# Altium schematic sheet ScreenerMobo.SchDoc
size A2; SheetNumber: 1; SheetTotal: 5
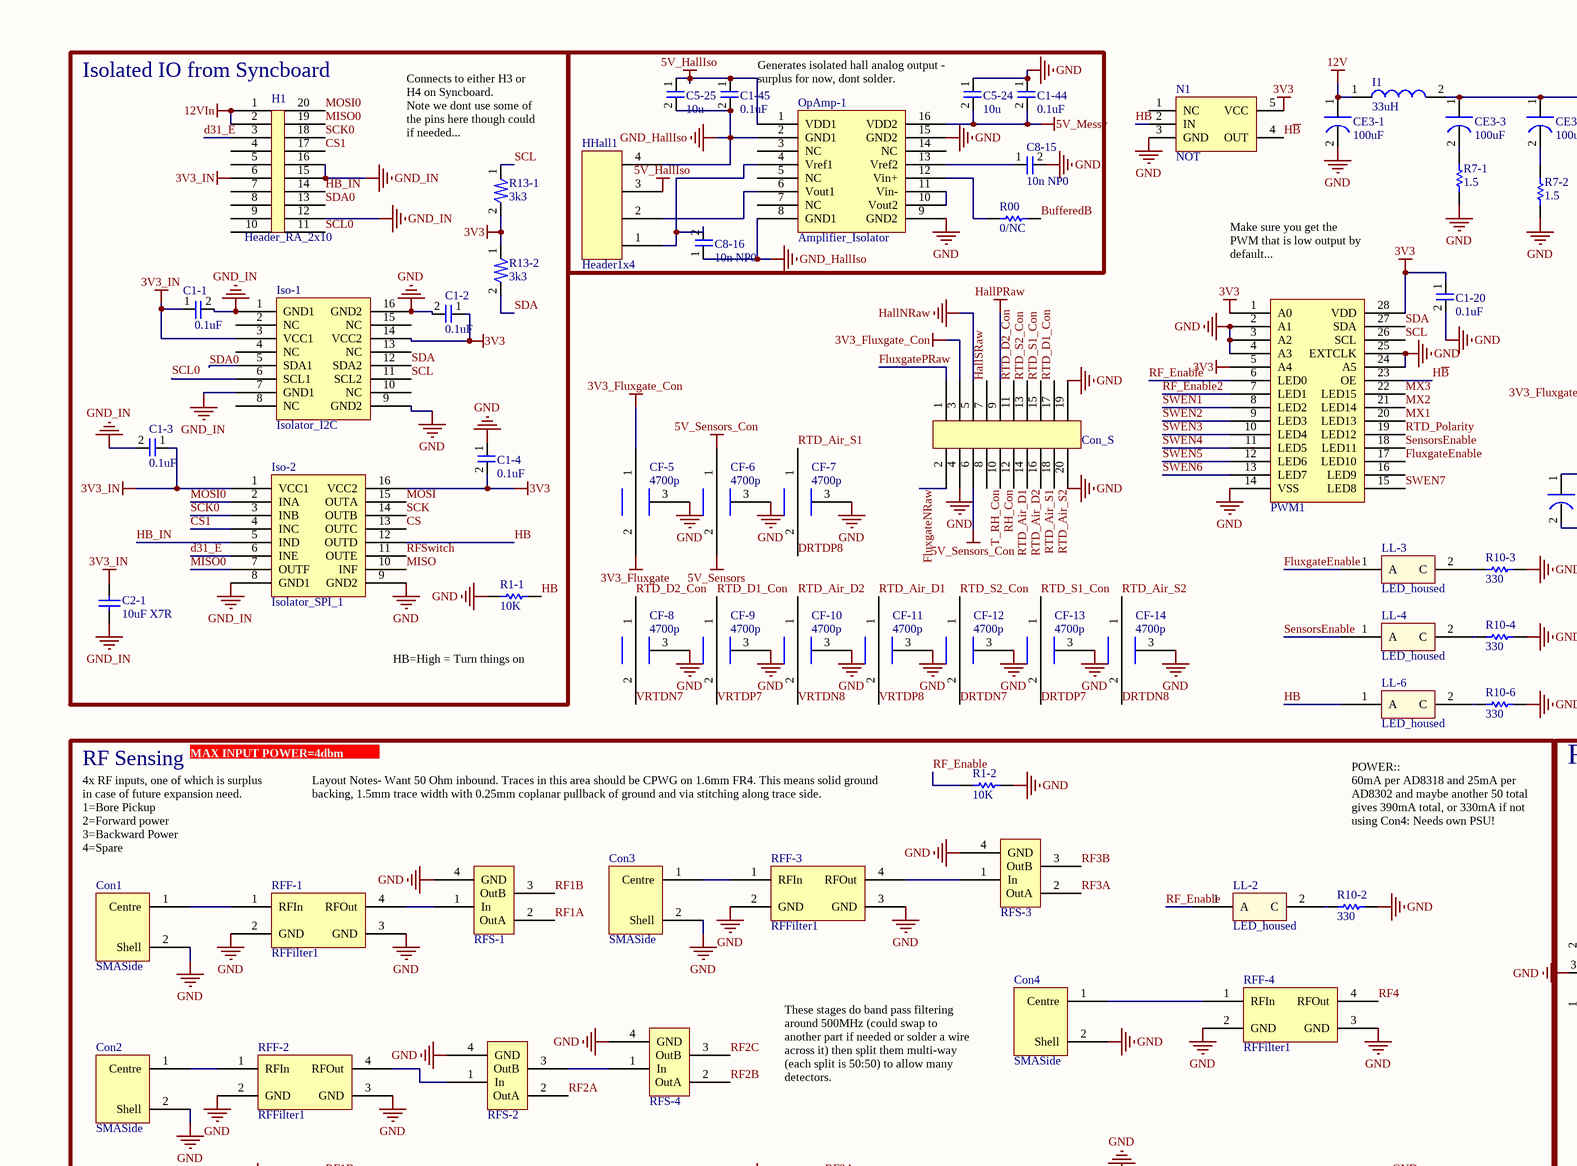
[diagram p0: ScreenerMobo.SchDoc, top left]
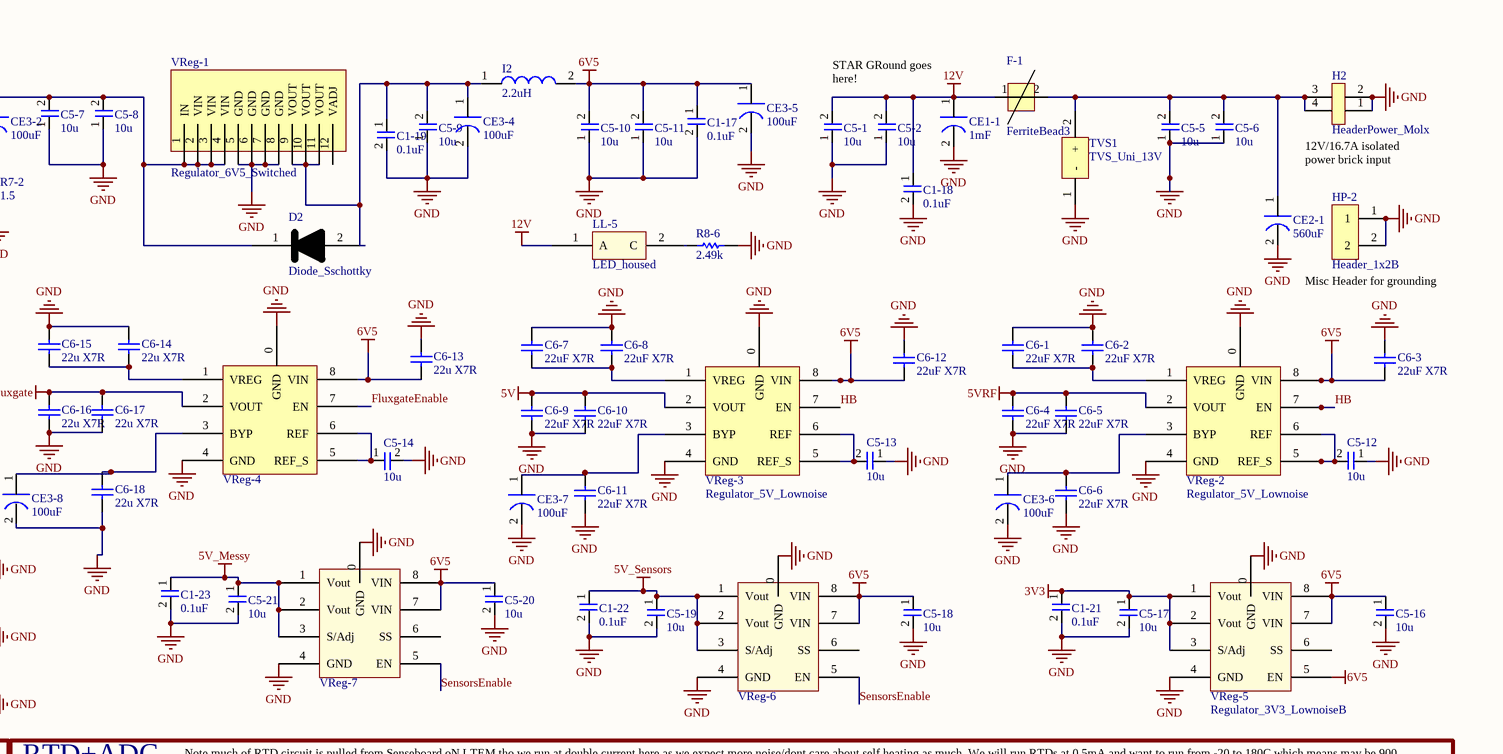
[diagram p1: ScreenerMobo.SchDoc, top right]
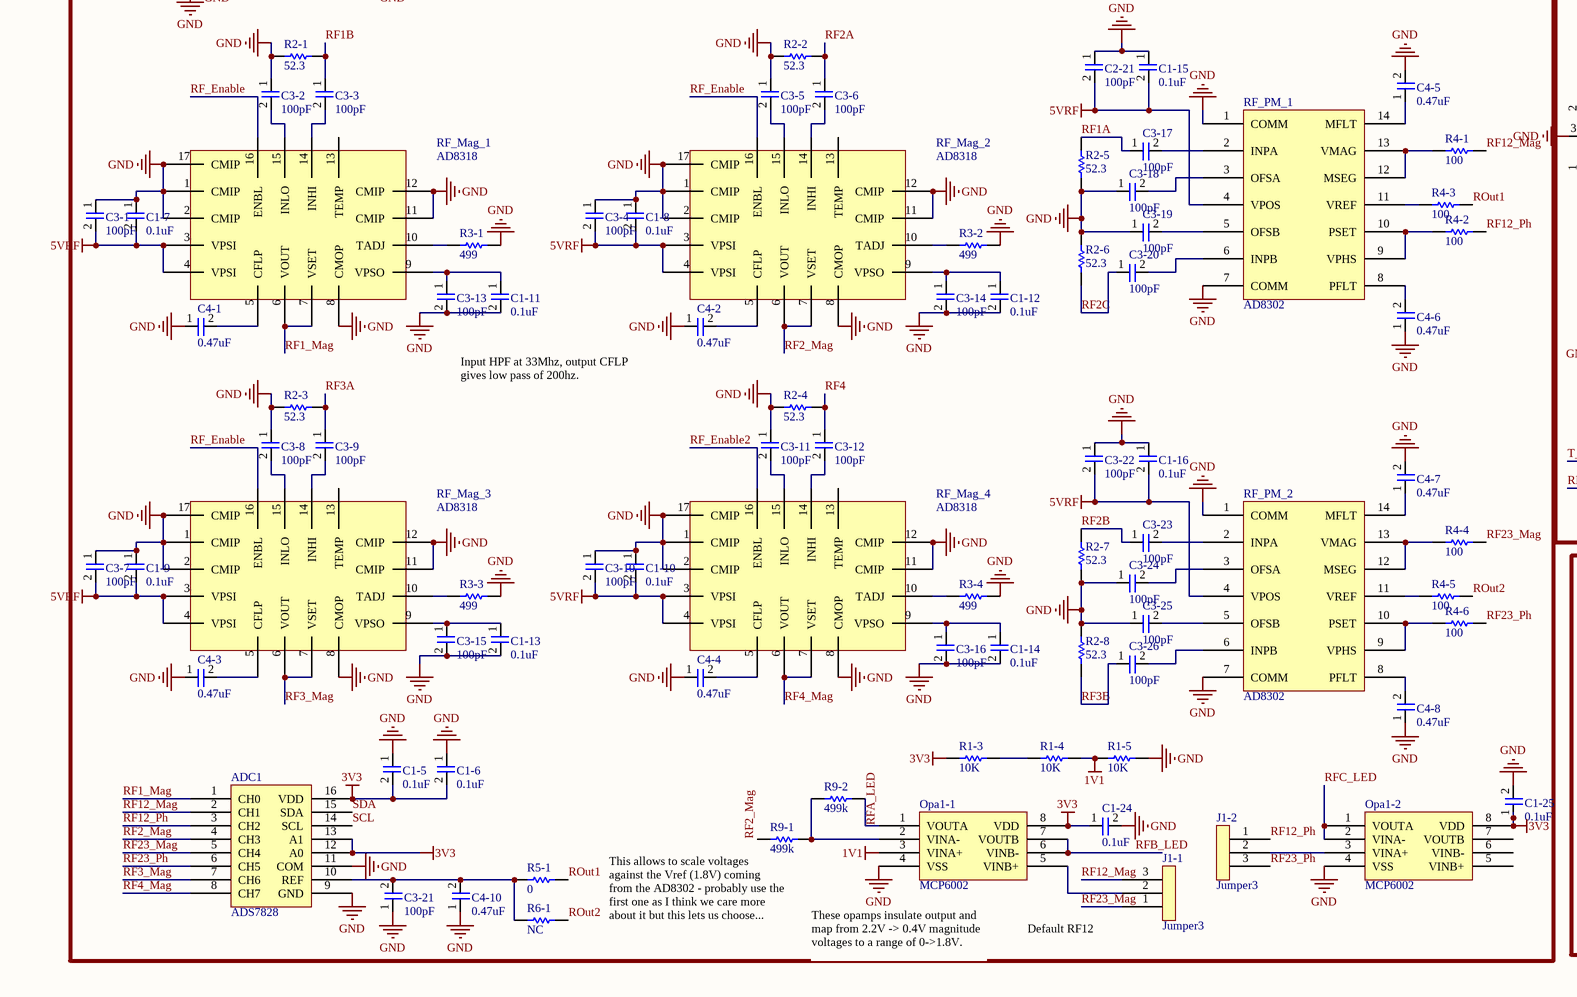
[diagram p2: ScreenerMobo.SchDoc, bottom left]
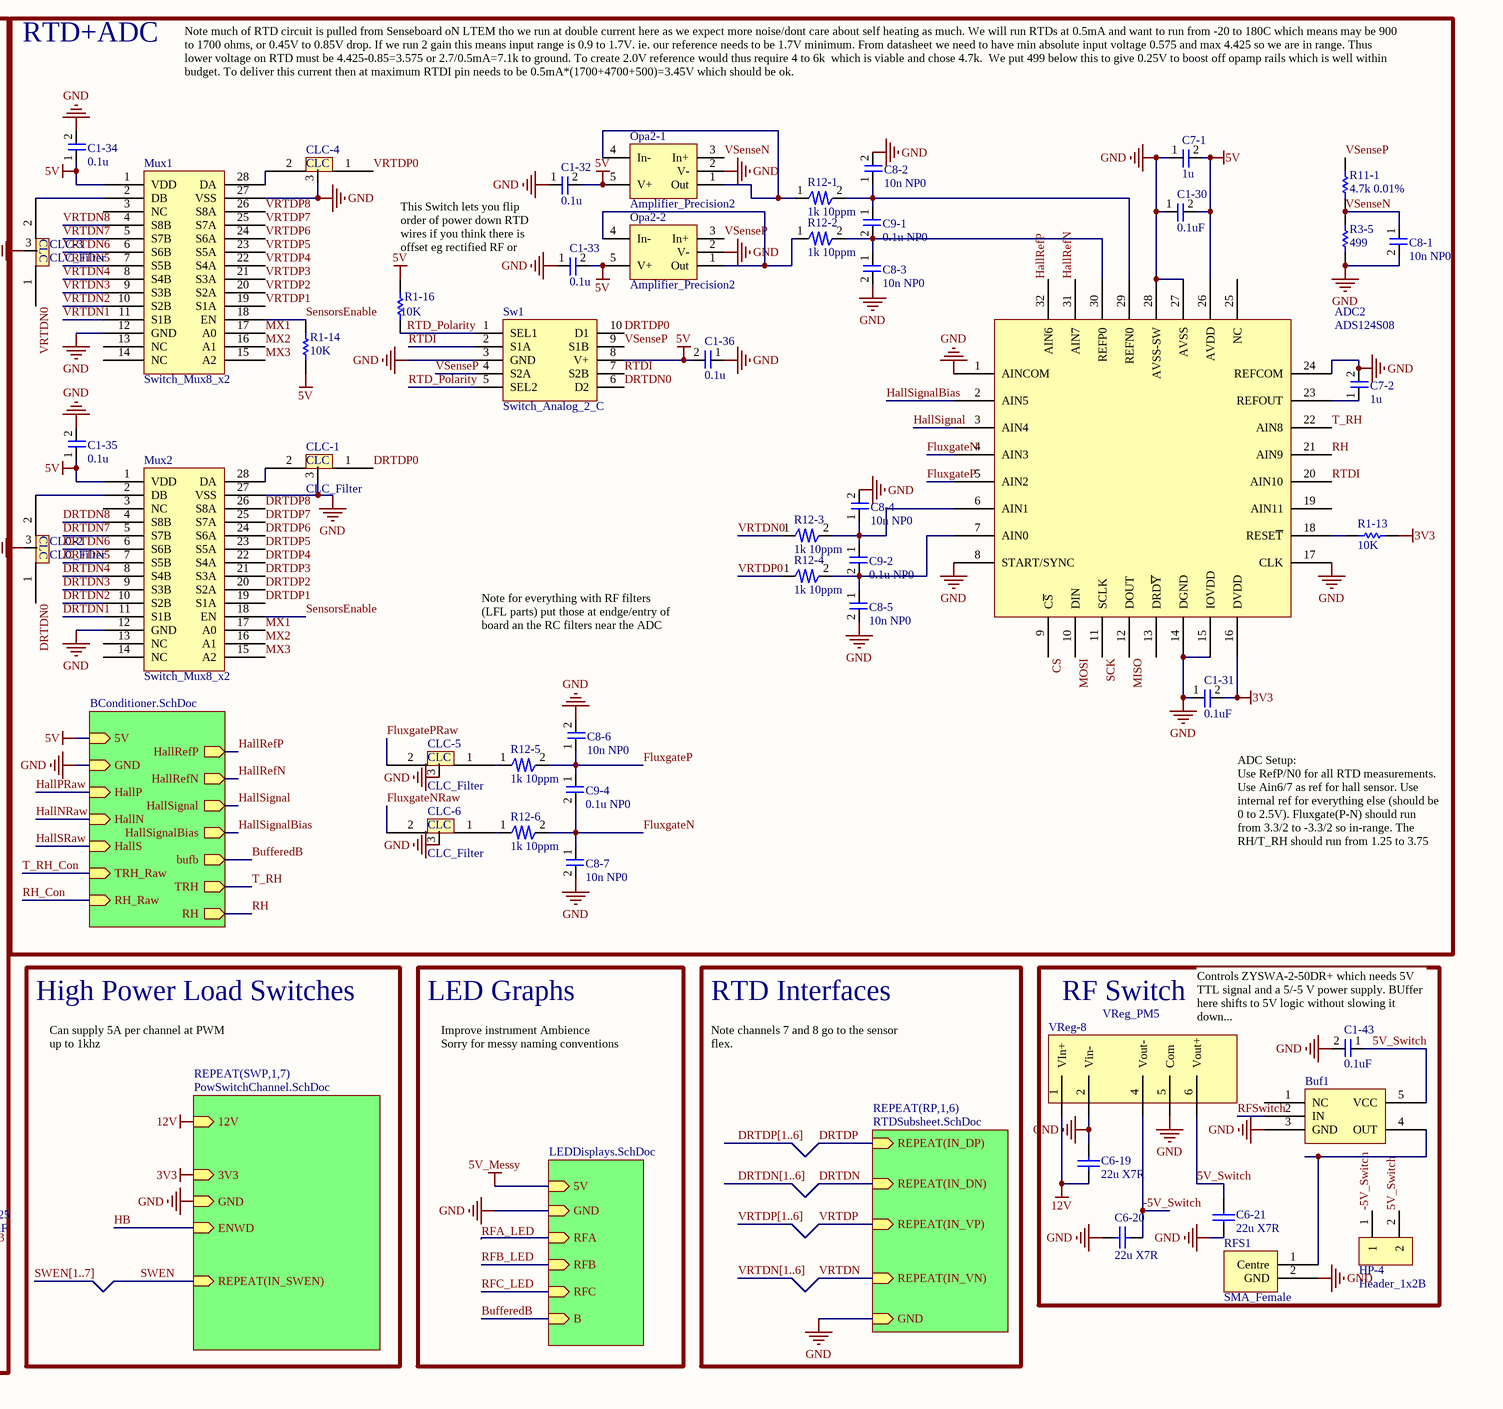
[diagram p3: ScreenerMobo.SchDoc, bottom right]

## Parts
ADC1  ADS7828  [16-TSSOP]
ADC2  ADS124S08  [32-TQFP]
Buf1  Buffer_Logic  [SOT23-5]  (value not drawn)
C1-1  0.1uF  [0805]
C1-2  0.1uF  [0805]
C1-3  0.1uF  [0805]
C1-4  0.1uF  [0805]
C1-5  0.1uF  [0805]
C1-6  0.1uF  [0805]
C1-7  0.1uF  [0805]
C1-8  0.1uF  [0805]
C1-9  0.1uF  [0805]
C1-10  0.1uF  [0805]
C1-11  0.1uF  [0805]
C1-12  0.1uF  [0805]
C1-13  0.1uF  [0805]
C1-14  0.1uF  [0805]
C1-15  0.1uF  [0805]
C1-16  0.1uF  [0805]
C1-17  0.1uF  [0805]
C1-18  0.1uF  [0805]
C1-19  0.1uF  [0805]
C1-20  0.1uF  [0805]
C1-21  0.1uF  [0805]
C1-22  0.1uF  [0805]
C1-23  0.1uF  [0805]
C1-24  0.1uF  [0805]
C1-25  0.1uF  [0805]
C1-30  0.1uF  [0805]
C1-31  0.1uF  [0805]
C1-32  0.1u  [0805]
C1-33  0.1u  [0805]
C1-34  0.1u  [0805]
C1-35  0.1u  [0805]
C1-36  0.1u  [0805]
C1-43  0.1uF  [0805]
C1-44  0.1uF  [0805]
C1-45  0.1uF  [0805]
C2-1  10uF X7R  [1206]
C2-21  100pF  [0402]
C3-1  100pF  [0402]
C3-2  100pF  [0402]
C3-3  100pF  [0402]
C3-4  100pF  [0402]
C3-5  100pF  [0402]
C3-6  100pF  [0402]
C3-7  100pF  [0402]
C3-8  100pF  [0402]
C3-9  100pF  [0402]
C3-10  100pF  [0402]
C3-11  100pF  [0402]
C3-12  100pF  [0402]
C3-13  100pF  [0402]
C3-14  100pF  [0402]
C3-15  100pF  [0402]
C3-16  100pF  [0402]
C3-17  100pF  [0402]
C3-18  100pF  [0402]
C3-19  100pF  [0402]
C3-20  100pF  [0402]
C3-21  100pF  [0402]
C3-22  100pF  [0402]
C3-23  100pF  [0402]
C3-24  100pF  [0402]
C3-25  100pF  [0402]
C3-26  100pF  [0402]
C4-1  0.47uF  [0805]
C4-2  0.47uF  [0805]
C4-3  0.47uF  [0805]
C4-4  0.47uF  [0805]
C4-5  0.47uF  [0805]
C4-6  0.47uF  [0805]
C4-7  0.47uF  [0805]
C4-8  0.47uF  [0805]
C4-10  0.47uF  [0805]
C5-1  10u  [1206]
C5-2  10u  [1206]
C5-5  10u  [1206]
C5-6  10u  [1206]
C5-7  10u  [1206]
C5-8  10u  [1206]
C5-9  10u  [1206]
C5-10  10u  [1206]
C5-11  10u  [1206]
C5-12  10u  [1206]
C5-13  10u  [1206]
C5-14  10u  [1206]
C5-16  10u  [1206]
C5-17  10u  [1206]
C5-18  10u  [1206]
C5-19  10u  [1206]
C5-20  10u  [1206]
C5-21  10u  [1206]
C5-24  10u  [1206]
C5-25  10u  [1206]
C6-1  22uF X7R  [1206]
C6-2  22uF X7R  [1206]
C6-3  22uF X7R  [1206]
C6-4  22uF X7R  [1206]
C6-5  22uF X7R  [1206]
C6-6  22uF X7R  [1206]
C6-7  22uF X7R  [1206]
C6-8  22uF X7R  [1206]
C6-9  22uF X7R  [1206]
C6-10  22uF X7R  [1206]
C6-11  22uF X7R  [1206]
C6-12  22uF X7R  [1206]
C6-13  22u X7R  [1206]
C6-14  22u X7R  [1206]
C6-15  22u X7R  [1206]
C6-16  22u X7R  [1206]
C6-17  22u X7R  [1206]
C6-18  22u X7R  [1206]
C6-19  22u X7R  [1206]
C6-20  22u X7R  [1206]
C6-21  22u X7R  [1206]
C7-1  1u  [0805]
C7-2  1u  [0805]
C8-1  10n NP0  [0805]
C8-2  10n NP0  [0805]
C8-3  10n NP0  [0805]
C8-4  10n NP0  [0805]
C8-5  10n NP0  [0805]
C8-6  10n NP0  [0805]
C8-7  10n NP0  [0805]
C8-15  10n NP0  [0805]
C8-16  10n NP0  [0805]
C9-1  0.1u NP0  [1206]
C9-2  0.1u NP0  [1206]
C9-4  0.1u NP0  [1206]
CE1-1  1mF  [CapElec]
CE2-1  560uF  [CapElec]
CE3-1  100uF  [ElectrolyticCapacitor3]
CE3-2  100uF  [ElectrolyticCapacitor3]
CE3-3  100uF  [ElectrolyticCapacitor3]
CE3-4  100uF  [ElectrolyticCapacitor3]
CE3-5  100uF  [ElectrolyticCapacitor3]
CE3-6  100uF  [ElectrolyticCapacitor3]
CE3-7  100uF  [ElectrolyticCapacitor3]
CE3-8  100uF  [ElectrolyticCapacitor3]
CF-5  4700p  [0402-Passthrough]
CF-6  4700p  [0402-Passthrough]
CF-7  4700p  [0402-Passthrough]
CF-8  4700p  [0402-Passthrough]
CF-9  4700p  [0402-Passthrough]
CF-10  4700p  [0402-Passthrough]
CF-11  4700p  [0402-Passthrough]
CF-12  4700p  [0402-Passthrough]
CF-13  4700p  [0402-Passthrough]
CF-14  4700p  [0402-Passthrough]
CLC-1  CLC_Filter  [CRCFilter]
CLC-2  CLC_Filter  [CRCFilter]
CLC-3  CLC_Filter  [CRCFilter]
CLC-4  CLC_Filter  [CRCFilter]  (value not drawn)
CLC-5  CLC_Filter  [CRCFilter]
CLC-6  CLC_Filter  [CRCFilter]
Con1  SMASide  [SMA_Side]
Con2  SMASide  [SMA_Side]
Con3  SMASide  [SMA_Side]
Con4  SMASide  [SMA_Side]
Con_S  Connector_LSHM_110  [Connector_LSHM_110]  (value not drawn)
D2  Diode_Sschottky  [SOD-123F]
F-1  FerriteBead3  [FerriteBead1]
H1  Header_RA_2x10  [HeaderRA 2x10]
H2  HeaderPower_Molx  [Header Molex Mini-Fit Jr 5569 - duplicate]
HHall1  Header1x4  [Header4x1]
HP-2  Header_1x2B  [Header_1x2B]
HP-4  Header_1x2B  [Header_1x2B]
I1  33uH  [INDUCTOR6]
I2  2.2uH  [INDUCTOR7]
Iso-1  Isolator_I2C  [16-SOIC Wide]
Iso-2  Isolator_SPI_1  [16-SOIC Wide]
J1-1  Jumper3  [Jumper]
J1-2  Jumper3  [Jumper]
LL-2  LED_housed  [LED_Housed]
LL-3  LED_housed  [LED_Housed]
LL-4  LED_housed  [LED_Housed]
LL-5  LED_housed  [LED_Housed]
LL-6  LED_housed  [LED_Housed]
Mux1  Switch_Mux8_x2  [28-TSSOP]
Mux2  Switch_Mux8_x2  [28-TSSOP]
N1  NOT  [SOT23-5]
Opa1-1  MCP6002  [8-MSOP]
Opa1-2  MCP6002  [8-MSOP]
Opa2-1  Amplifier_Precision2  [SOT23-5]
Opa2-2  Amplifier_Precision2  [SOT23-5]
OpAmp-1  Amplifier_Isolator  [16-QSOP]
PWM1  PWM28  [28-TSSOP]  (value not drawn)
R00  0/NC  [0603]
R1-1  10K  [0603]
R1-2  10K  [0603]
R1-3  10K  [0603]
R1-4  10K  [0603]
R1-5  10K  [0603]
R1-13  10K  [0603]
R1-14  10K  [0603]
R1-16  10K  [0603]
R2-1  52.3  [0603]
R2-2  52.3  [0603]
R2-3  52.3  [0603]
R2-4  52.3  [0603]
R2-5  52.3  [0603]
R2-6  52.3  [0603]
R2-7  52.3  [0603]
R2-8  52.3  [0603]
R3-1  499  [0603]
R3-2  499  [0603]
R3-3  499  [0603]
R3-4  499  [0603]
R3-5  499  [0603]
R4-1  100  [0603]
R4-2  100  [0603]
R4-3  100  [0603]
R4-4  100  [0603]
R4-5  100  [0603]
R4-6  100  [0603]
R5-1  0  [0603]
R6-1  NC  [0603]
R7-1  1.5  [1206]
R7-2  1.5  [1206]
R8-6  2.49k  [0603]
R9-1  499k  [0603]
R9-2  499k  [0603]
R10-2  330  [0603]
R10-3  330  [0603]
R10-4  330  [0603]
R10-6  330  [0603]
R11-1  4.7k 0.01%  [0805]
R12-1  1k 10ppm  [0805]
R12-2  1k 10ppm  [0805]
R12-3  1k 10ppm  [0805]
R12-4  1k 10ppm  [0805]
R12-5  1k 10ppm  [0805]
R12-6  1k 10ppm  [0805]
R13-1  3k3  [0805]
R13-2  3k3  [0805]
RF_Mag_1  AD8318  [16-LFCSP]
RF_Mag_2  AD8318  [16-LFCSP]
RF_Mag_3  AD8318  [16-LFCSP]
RF_Mag_4  AD8318  [16-LFCSP]
RF_PM_1  AD8302  [14-TSSOP]
RF_PM_2  AD8302  [14-TSSOP]
RFF-1  RFFilter1  [RFFilter1]
RFF-2  RFFilter1  [RFFilter1]
RFF-3  RFFilter1  [RFFilter1]
RFF-4  RFFilter1  [RFFilter1]
RFS1  SMA_Female  [SMA_Ferrite]
RFS-1  RFSplitter1  [PS3216]  (value not drawn)
RFS-2  RFSplitter1  [PS3216]  (value not drawn)
RFS-3  RFSplitter1  [PS3216]  (value not drawn)
RFS-4  RFSplitter1  [PS3216]  (value not drawn)
Sw1  Switch_Analog_2_C  [10-VSSOP]
TVS1  TVS_Uni_13V  [DO-214AB-Uni]
VReg-1  Regulator_6V5_Switched  [12-SIP]
VReg-2  Regulator_5V_Lownoise  [8-SOIC]
VReg-3  Regulator_5V_Lownoise  [8-SOIC]
VReg-4  Regulator_3V3_Lownoise  [8-SOIC]  (value not drawn)
VReg-5  Regulator_3V3_LownoiseB  [8-SOIC]
VReg-6  Regulator_3V3_LownoiseB  [8-SOIC]  (value not drawn)
VReg-7  Regulator_3V3_LownoiseB  [8-SOIC]  (value not drawn)
VReg-8  VReg_PM5  [7-SIP]

## Blocks framed on the sheet
Isolated IO from Syncboard: C1-1-C1-4 C2-1 H1 Iso-1 Iso-2 R1-1 R13-1 R13-2
RF Sensing: ADC1 C1-5-C1-16 C1-24 C1-25 C2-21 C3-1-C3-26 C4-1-C4-8 C4-10 Con1-Con4 J1-1 J1-2 LL-2 Opa1-1 Opa1-2 R1-2-R1-5 R2-1-R2-8 R3-1-R3-4 R4-1-R4-6 R5-1 R6-1 R9-1 R9-2 R10-2 RF_Mag_1-RF_Mag_4 RF_PM_1 RF_PM_2 RFF-1-RFF-4 RFS-1-RFS-4
RTD+ADC: ADC2 C1-30-C1-36 C7-1 C7-2 C8-1-C8-7 C9-1 C9-2 C9-4 CLC-1-CLC-6 Mux1 Mux2 Opa2-1 Opa2-2 R1-13 R1-14 R1-16 R3-5 R11-1 R12-1-R12-6 Sw1
RF Switch: Buf1 C1-43 C6-19-C6-21 HP-4 RFS1 VReg-8

## Sub-sheets
Designator = BConditioner.SchDoc: 5V (in), GND (in), HallP (in), HallN (in), HallS (in), HallRefP (out), HallRefN (out), HallSignal (out), HallSignalBias (out), TRH_Raw (in), RH_Raw (in), TRH (out), RH (out), bufb (out)
REPEAT(RP,1,6) = RTDSubsheet.SchDoc: GND (in), REPEAT(IN_VN) (in), REPEAT(IN_VP) (in), REPEAT(IN_DN) (in), REPEAT(IN_DP) (in)
REPEAT(SWP,1,7) = PowSwitchChannel.SchDoc: 12V (in), 3V3 (in), GND (in), ENWD (in), REPEAT(IN_SWEN) (in)
? = LEDDisplays.SchDoc: 5V (in), RFA (in), GND (in), RFB (in), RFC (in), B (in)

## Nets
1V1: Opa1-1.3(VINA+) R1-4.1 R1-5.2
3V3: ADC1.12(A0) ADC1.13(A1) ADC1.16(VDD) ADC2.16(DVDD) C1-2.1 C1-4.2 C1-5.2 C1-6.2 C1-20.1 C1-21.1 C1-24.1 C1-25.1 C1-31.2 C5-17.1 Iso-1.14(VCC2) Iso-2.16(VCC2) N1.5(VCC) Opa1-1.8(VDD) Opa1-2.8(VDD) PWM1.1(A0) PWM1.5(A4) PWM1.28(VDD) R1-3.2 R1-13.2 R13-1.2 R13-2.1 VReg-5.1(Vout) VReg-5.2(Vout) VReg-5.3(S/Adj) ; sheet REPEAT(SWP,1,7)/3V3
3V3_Fluxgate: C6-16.2 C6-17.2 CF-5.2 VReg-4.2(VOUT)
3V3_Fluxgate_Con: CF-5.1 Con_S.3
3V3_IN: C1-1.1 C1-3.1 C2-1.1 H1.6 Iso-1.3(VCC1) Iso-2.1(VCC1)
5V: ADC2.26(AVDD) C1-30.2 C1-32.2 C1-33.2 C1-34.1 C1-35.1 C1-36.2 C6-9.2 C6-10.2 C7-1.2 Mux1.1(VDD) Mux2.1(VDD) Opa2-1.5(V+) Opa2-2.5(V+) R1-14.2 R1-16.1 Sw1.8(V+) VReg-3.2(VOUT) ; sheet Designator/5V
5V_HallIso: C1-45.1 C5-25.1 HHall1.3 OpAmp-1.1(VDD1)
5V_Messy: C1-23.1 C1-44.2 C5-21.1 C5-24.2(C1-1) OpAmp-1.16(VDD2) VReg-7.1(Vout) VReg-7.2(Vout) VReg-7.3(S/Adj) ; sheet /5V
5V_Sensors: C1-22.1 C5-19.1 CF-6.2 VReg-6.1(Vout) VReg-6.2(Vout) VReg-6.3(S/Adj)
5V_Sensors_Con: CF-6.1 Con_S.6
5VRF: C1-7.2 C1-8.2 C1-9.2 C1-10.2 C1-15.2 C1-16.2 C2-21.2 C3-1.2 C3-4.2 C3-7.2 C3-10.2 C3-22.2 C6-4.2 C6-5.2 RF_Mag_1.3(VPSI) RF_Mag_1.4(VPSI) RF_Mag_2.3(VPSI) RF_Mag_2.4(VPSI) RF_Mag_3.3(VPSI) RF_Mag_3.4(VPSI) RF_Mag_4.3(VPSI) RF_Mag_4.4(VPSI) RF_PM_1.4(VPOS) RF_PM_2.4(VPOS) VReg-2.2(VOUT)
6V5: C1-17.1 C5-10.2(C1-1) C5-11.2(C1-1) C5-16.1 C5-18.1 C5-20.1 C6-3.1 C6-12.1 C6-13.1 CE3-5.1 I2.2 VReg-2.8(VIN) VReg-3.8(VIN) VReg-4.8(VIN) VReg-5.5(EN) VReg-5.7(VIN) VReg-5.8(VIN) VReg-6.7(VIN) VReg-6.8(VIN) VReg-7.7(VIN) VReg-7.8(VIN)
12V: C1-18.1 C5-1.2(C1-1) C5-2.2(C1-1) C6-19.2 CE1-1.1 CE3-1.1 F-1.1 I1.1 LL-5.1(A) VReg-8.1(VIn+) ; sheet REPEAT(SWP,1,7)/12V
12VIn: H1.1 H1.2
GND: ADC1.9(GND) ADC1.11(COM) ADC2.1(AINCOM) ADC2.8(START/SYNC) ADC2.14(DGND) ADC2.15(IOVDD) ADC2.17(CLK) ADC2.24(REFCOM) ADC2.27(AVSS) ADC2.28(AVSS-SW) Buf1.3(GND) C1-2.2 C1-4.1 C1-5.1 C1-6.1 C1-7.1 C1-8.1 C1-9.1 C1-10.1 C1-11.2 C1-12.2 C1-13.2 C1-14.2 C1-15.1 C1-16.1 C1-17.2 C1-18.2 C1-19.2 C1-20.2 C1-21.2 C1-22.2 C1-23.2 C1-24.2 C1-25.2 C1-30.1 C1-31.1 C1-32.1 C1-33.1 C1-34.2 C1-35.2 C1-36.1 C1-43.2 C1-44.1 C2-21.1 C3-1.1 C3-2.1 C3-4.1 C3-5.1 C3-7.1 C3-8.1 C3-10.1 C3-11.1 C3-13.2 C3-14.2 C3-15.2 C3-16.2 C3-18.1 C3-19.1 C3-21.1 C3-22.1 C3-24.1 C3-25.1 C4-1.1 C4-2.1 C4-3.1 C4-4.1 C4-5.2 C4-6.1 C4-7.2 C4-8.1 C4-10.1 C5-1.1 C5-2.1 C5-5.1 C5-6.1 C5-7.1 C5-8.1 C5-9.1 C5-10.1 C5-11.1 C5-12.1 C5-13.1 C5-14.2 C5-16.2 C5-17.2 C5-18.2 C5-19.2 C5-20.2 C5-21.2 C5-24.1 C6-1.2 C6-2.2 C6-3.2 C6-4.1 C6-5.1 C6-6.1 C6-7.2 C6-8.2 C6-9.1 C6-10.1 C6-11.1 C6-12.2 C6-13.2 C6-14.2 C6-15.2 C6-16.1 C6-17.1 C6-18.1 C6-19.1 C6-20.1 C6-21.1 C7-1.1 C7-2.2 C8-1.2 C8-2.2 C8-3.2 C8-4.2 C8-5.2 C8-6.2 C8-7.2 C8-15.2 CE1-1.2 CE2-1.2 CE3-1.2 CE3-4.2 CE3-5.2 CE3-6.2 CE3-7.2 CE3-8.2 CF-5.3 CF-6.3 CF-7.3 CF-8.3 CF-9.3 CF-10.3 CF-11.3 CF-12.3 CF-13.3 CF-14.3 CLC-1.3 CLC-2.3 CLC-3.3 CLC-4.3 CLC-5.3 CLC-6.3 Con1.2(Shell) Con2.2(Shell) Con3.2(Shell) Con4.2(Shell) Con_S.4 Con_S.19 Con_S.20 H2.1 H2.2 HP-2.1 HP-2.2 Iso-1.9(GND2) Iso-1.16(GND2) Iso-2.9(GND2) Mux1.12(GND) Mux1.27(VSS) Mux2.12(GND) Mux2.27(VSS) N1.3(GND) Opa1-1.4(VSS) Opa1-2.4(VSS) Opa2-1.2(V-) Opa2-2.2(V-) OpAmp-1.9(GND2) OpAmp-1.15(GND2) PWM1.2(A1) PWM1.3(A2) PWM1.4(A3) PWM1.14(VSS) PWM1.24(A5) PWM1.25(EXTCLK) R1-1.1 R1-2.1 R1-5.1 R2-1.2 R2-2.2 R2-3.2 R2-4.2 R2-5.2 R2-6.1 R2-7.2 R2-8.1 R3-1.1 R3-2.1 R3-3.1 R3-4.1 R3-5.1 R7-1.2 R7-2.2 R8-6.2 R10-2.1 R10-3.1 R10-4.1 R10-6.1 RF_Mag_1.1(CMIP) RF_Mag_1.2(CMIP) RF_Mag_1.8(CMOP) RF_Mag_1.11(CMIP) RF_Mag_1.12(CMIP) RF_Mag_1.17(CMIP) RF_Mag_2.1(CMIP) RF_Mag_2.2(CMIP) RF_Mag_2.8(CMOP) RF_Mag_2.11(CMIP) RF_Mag_2.12(CMIP) RF_Mag_2.17(CMIP) RF_Mag_3.1(CMIP) RF_Mag_3.2(CMIP) RF_Mag_3.8(CMOP) RF_Mag_3.11(CMIP) RF_Mag_3.12(CMIP) RF_Mag_3.17(CMIP) RF_Mag_4.1(CMIP) RF_Mag_4.2(CMIP) RF_Mag_4.8(CMOP) RF_Mag_4.11(CMIP) RF_Mag_4.12(CMIP) RF_Mag_4.17(CMIP) RF_PM_1.1(COMM) RF_PM_1.7(COMM) RF_PM_2.1(COMM) RF_PM_2.7(COMM) RFF-1.2(GND) RFF-1.3(GND) RFF-2.2(GND) RFF-2.3(GND) RFF-3.2(GND) RFF-3.3(GND) RFF-4.2(GND) RFF-4.3(GND) RFS1.2(GND) RFS-1.4(GND) RFS-2.4(GND) RFS-3.4(GND) RFS-4.4(GND) Sw1.3(GND) TVS1.1(-) VReg-1.5(GND) VReg-1.6(GND) VReg-1.7(GND) VReg-1.8(GND) VReg-2.0(GND) VReg-2.4(GND) VReg-3.0(GND) VReg-3.4(GND) VReg-4.0(GND) VReg-4.4(GND) VReg-5.0(GND) VReg-5.4(GND) VReg-6.0(GND) VReg-6.4(GND) VReg-7.0(GND) VReg-7.4(GND) VReg-8.2(Vin-) VReg-8.5(Com) ; sheet REPEAT(SWP,1,7)/GND, sheet /GND, sheet Designator/GND, sheet REPEAT(RP,1,6)/GND
GND_HallIso: C1-45.2 C5-25.2(C1-1) C8-16.1 HHall1.4 OpAmp-1.2(GND1) OpAmp-1.8(GND1)
GND_IN: C1-1.2 C1-3.2 C2-1.2 H1.12 H1.15 H1.16 Iso-1.1(GND1) Iso-1.7(GND1) Iso-2.8(GND1)
HallNRaw: Con_S.5 ; sheet Designator/HallN
HallPRaw: Con_S.9 ; sheet Designator/HallP
5V_Switch: Buf1.5(VCC) C1-43.1 C6-21.2 HP-4.2 VReg-8.6(Vout+)
-5V_Switch: C6-20.2 HP-4.1 VReg-8.4(Vout-)
BufferedB: R00.1 ; sheet /B, sheet Designator/bufb
CS: ADC2.9(C~{S}) Iso-2.13(OUTC)
CS1: H1.17 Iso-2.4(INC)
d31_E: H1.3 Iso-2.6(INE)
DRTDN: sheet REPEAT(RP,1,6)/REPEAT(IN_DN)
DRTDN0: CLC-2.1 Sw1.6(D2)
DRTDN1: Mux2.11(S1B)
DRTDN2: Mux2.10(S2B)
DRTDN3: Mux2.9(S3B)
DRTDN4: Mux2.8(S4B)
DRTDN5: Mux2.7(S5B)
DRTDN6: Mux2.6(S6B)
DRTDN7: CF-12.2 Mux2.5(S7B)
DRTDN8: CF-14.2 Mux2.4(S8B)
DRTDP: sheet REPEAT(RP,1,6)/REPEAT(IN_DP)
DRTDP0: CLC-1.1 Sw1.10(D1)
DRTDP1: Mux2.19(S1A)
DRTDP2: Mux2.20(S2A)
DRTDP3: Mux2.21(S3A)
DRTDP4: Mux2.22(S4A)
DRTDP5: Mux2.23(S5A)
DRTDP6: Mux2.24(S6A)
DRTDP7: CF-13.2 Mux2.25(S7A)
DRTDP8: CF-7.2 Mux2.26(S8A)
FluxgateEnable: LL-3.1(A) PWM1.17(LED10) VReg-4.7(EN)
FluxgateN: ADC2.4(AIN3) C8-7.1 C9-4.2 R12-6.2
FluxgateNRaw: CLC-6.2 Con_S.2
FluxgateP: ADC2.5(AIN2) C8-6.1 C9-4.1 R12-5.2
FluxgatePRaw: CLC-5.2 Con_S.1
HallRefN: ADC2.31(AIN7) ; sheet Designator/HallRefN
HallRefP: ADC2.32(AIN6) ; sheet Designator/HallRefP
HallSignal: ADC2.3(AIN4) ; sheet Designator/HallSignal
HallSignalBias: ADC2.2(AIN5) ; sheet Designator/HallSignalBias
HallSRaw: Con_S.7 ; sheet Designator/HallS
HB: Iso-2.12(OUTD) LL-6.1(A) N1.2(IN) R1-1.2 VReg-2.7(EN) VReg-3.7(EN) ; sheet REPEAT(SWP,1,7)/ENWD
H~{B}: N1.4(OUT) PWM1.23(OE)
HB_IN: H1.14 Iso-2.5(IND)
MISO: ADC2.12(DOUT) Iso-2.10(INF)
MISO0: H1.19 Iso-2.7(OUTF)
MOSI: ADC2.10(DIN) Iso-2.15(OUTA)
MOSI0: H1.20 Iso-2.2(INA)
MX1: Mux1.17(A0) Mux2.17(A0) PWM1.20(LED13)
MX2: Mux1.16(A1) Mux2.16(A1) PWM1.21(LED14)
MX3: Mux1.15(A2) Mux2.15(A2) PWM1.22(LED15)
RF1_Mag: ADC1.1(CH0) RF_Mag_1.6(VOUT) RF_Mag_1.7(VSET)
RF1A: C3-17.1 R2-5.1 RFS-1.2(OutA)
RF1B: C3-3.1 R2-1.1 RFS-1.3(OutB)
RF2_Mag: ADC1.4(CH3) R9-1.1 RF_Mag_2.6(VOUT) RF_Mag_2.7(VSET)
RF2A: C3-6.1 R2-2.1 RFS-2.2(OutA)
RF2B: C3-23.1 R2-7.1 RFS-4.2(OutA)
RF2C: C3-20.1 R2-6.2 RFS-4.3(OutB)
RF3_Mag: ADC1.7(CH6) RF_Mag_3.6(VOUT) RF_Mag_3.7(VSET)
RF3A: C3-9.1 R2-3.1 RFS-3.2(OutA)
RF3B: C3-26.1 R2-8.2 RFS-3.3(OutB)
RF4: C3-12.1 R2-4.1 RFF-4.4(RFOut)
RF4_Mag: ADC1.8(CH7) RF_Mag_4.6(VOUT) RF_Mag_4.7(VSET)
RF12_Mag: ADC1.2(CH1) J1-1.3 R4-1.1
RF12_Ph: ADC1.3(CH2) J1-2.1 R4-2.1
RF23_Mag: ADC1.5(CH4) J1-1.1 R4-4.1
RF23_Ph: ADC1.6(CH5) J1-2.3 R4-6.1
RF_Enable: LL-2.1(A) PWM1.6(LED0) R1-2.2 RF_Mag_1.16(ENBL) RF_Mag_2.16(ENBL) RF_Mag_3.16(ENBL)
RF_Enable2: PWM1.7(LED1) RF_Mag_4.16(ENBL)
RFA_LED: Opa1-1.1(VOUTA) R9-2.2 ; sheet /RFA
RFB_LED: Opa1-1.6(VINB-) Opa1-1.7(VOUTB) ; sheet /RFB
RFC_LED: Opa1-2.1(VOUTA) Opa1-2.2(VINA-) ; sheet /RFC
RFSwitch: Buf1.2(IN) Iso-2.11(OUTE)
RH: ADC2.21(AIN9) ; sheet Designator/RH
RH_Con: Con_S.10 ; sheet Designator/RH_Raw
ROut1: R4-3.1 R5-1.2
ROut2: R4-5.1 R6-1.2
RTD_Air_D1: CF-11.1 Con_S.12
RTD_Air_D2: CF-10.1 Con_S.14
RTD_Air_S1: CF-7.1 Con_S.16
RTD_Air_S2: CF-14.1 Con_S.18
RTD_D1_Con: CF-9.1 Con_S.17
RTD_D2_Con: CF-8.1 Con_S.11
RTD_Polarity: PWM1.19(LED12) R1-16.2 Sw1.1(SEL1) Sw1.5(SEL2)
RTD_S1_Con: CF-13.1 Con_S.15
RTD_S2_Con: CF-12.1 Con_S.13
RTDI: ADC2.20(AIN10) Sw1.2(S1A) Sw1.7(S2B)
SCK: ADC2.11(SCLK) Iso-2.14(OUTB)
SCK0: H1.18 Iso-2.3(INB)
SCL: ADC1.14(SCL) Iso-1.11(SCL2) PWM1.26(SCL) R13-1.1
SCL0: H1.11 Iso-1.6(SCL1)
SDA: ADC1.15(SDA) Iso-1.12(SDA2) PWM1.27(SDA) R13-2.2
SDA0: H1.13 Iso-1.5(SDA1)
SensorsEnable: LL-4.1(A) Mux1.18(EN) Mux2.18(EN) PWM1.18(LED11) R1-14.1 VReg-6.5(EN) VReg-7.5(EN)
SWEN: sheet REPEAT(SWP,1,7)/REPEAT(IN_SWEN)
SWEN1: PWM1.8(LED2)
SWEN2: PWM1.9(LED3)
SWEN3: PWM1.10(LED4)
SWEN4: PWM1.11(LED5)
SWEN5: PWM1.12(LED6)
SWEN6: PWM1.13(LED7)
SWEN7: PWM1.15(LED8)
T_RH: ADC2.22(AIN8) ; sheet Designator/TRH
T_RH_Con: Con_S.8 ; sheet Designator/TRH_Raw
VRTDN: sheet REPEAT(RP,1,6)/REPEAT(IN_VN)
VRTDN0: CLC-3.1 R12-3.1
VRTDN1: Mux1.11(S1B)
VRTDN2: Mux1.10(S2B)
VRTDN3: Mux1.9(S3B)
VRTDN4: Mux1.8(S4B)
VRTDN5: Mux1.7(S5B)
VRTDN6: Mux1.6(S6B)
VRTDN7: CF-8.2 Mux1.5(S7B)
VRTDN8: CF-10.2 Mux1.4(S8B)
VRTDP: sheet REPEAT(RP,1,6)/REPEAT(IN_VP)
VRTDP0: CLC-4.1 R12-4.1
VRTDP1: Mux1.19(S1A)
VRTDP2: Mux1.20(S2A)
VRTDP3: Mux1.21(S3A)
VRTDP4: Mux1.22(S4A)
VRTDP5: Mux1.23(S5A)
VRTDP6: Mux1.24(S6A)
VRTDP7: CF-9.2 Mux1.25(S7A)
VRTDP8: CF-11.2 Mux1.26(S8A)
VSenseN: C8-1.1 Opa2-1.3(In+) R3-5.2 R11-1.1
VSenseP: Opa2-2.3(In+) R11-1.2 Sw1.4(S2A) Sw1.9(S1B)
NetADC1_10: ADC1.10(REF) C3-21.2 C4-10.2 R5-1.1 R6-1.1
NetADC2_6: ADC2.6(AIN1) C8-4.1 C9-2.1 R12-3.2
NetADC2_7: ADC2.7(AIN0) C8-5.1 C9-2.2 R12-4.2
NetADC2_18: ADC2.18(RESE~{T}) R1-13.1
NetADC2_23: ADC2.23(REFOUT) C7-2.1
NetADC2_29: ADC2.29(REFN0) C8-2.1 C9-1.1 R12-1.2
NetADC2_30: ADC2.30(REFP0) C8-3.1 C9-1.2 R12-2.2
NetBuf1_4: Buf1.4(OUT) RFS1.1(Centre)
NetC1-11_1: C1-11.1 C3-13.1 RF_Mag_1.9(VPSO)
NetC1-12_1: C1-12.1 C3-14.1 RF_Mag_2.9(VPSO)
NetC1-13_1: C1-13.1 C3-15.1 RF_Mag_3.9(VPSO)
NetC1-14_1: C1-14.1 C3-16.1 RF_Mag_4.9(VPSO)
NetC1-19_1: C1-19.1 C5-9.2(C1-1) CE3-4.1 D2.2(VCC) I2.1 VReg-1.9(VOUT) VReg-1.10(VOUT) VReg-1.11(VOUT)
NetC3-2_2: C3-2.2 RF_Mag_1.15(INLO)
NetC3-3_2: C3-3.2 RF_Mag_1.14(INHI)
NetC3-5_2: C3-5.2 RF_Mag_2.15(INLO)
NetC3-6_2: C3-6.2 RF_Mag_2.14(INHI)
NetC3-8_2: C3-8.2 RF_Mag_3.15(INLO)
NetC3-9_2: C3-9.2 RF_Mag_3.14(INHI)
NetC3-11_2: C3-11.2 RF_Mag_4.15(INLO)
NetC3-12_2: C3-12.2 RF_Mag_4.14(INHI)
NetC3-17_2: C3-17.2 RF_PM_1.2(INPA)
NetC3-18_2: C3-18.2 RF_PM_1.3(OFSA)
NetC3-19_2: C3-19.2 RF_PM_1.5(OFSB)
NetC3-20_2: C3-20.2 RF_PM_1.6(INPB)
NetC3-23_2: C3-23.2 RF_PM_2.2(INPA)
NetC3-24_2: C3-24.2 RF_PM_2.3(OFSA)
NetC3-25_2: C3-25.2 RF_PM_2.5(OFSB)
NetC3-26_2: C3-26.2 RF_PM_2.6(INPB)
NetC4-1_2: C4-1.2 RF_Mag_1.5(CFLP)
NetC4-2_2: C4-2.2 RF_Mag_2.5(CFLP)
NetC4-3_2: C4-3.2 RF_Mag_3.5(CFLP)
NetC4-4_2: C4-4.2 RF_Mag_4.5(CFLP)
NetC4-5_1: C4-5.1 RF_PM_1.14(MFLT)
NetC4-6_2: C4-6.2 RF_PM_1.8(PFLT)
NetC4-7_1: C4-7.1 RF_PM_2.14(MFLT)
NetC4-8_2: C4-8.2 RF_PM_2.8(PFLT)
NetC5-5_2: C5-5.2(C1-1) C5-6.2(C1-1) CE2-1.1 F-1.2 H2.3 H2.4 TVS1.2(+)
NetC5-7_2: C5-7.2(C1-1) C5-8.2(C1-1) CE3-2.1 CE3-3.1 D2.1(GND) I1.2 VReg-1.1(IN) VReg-1.2(VIN) VReg-1.3(VIN) VReg-1.4(VIN)
NetC5-12_2: C5-12.2(C1-1) VReg-2.5(REF_S) VReg-2.6(REF)
NetC5-13_2: C5-13.2(C1-1) VReg-3.5(REF_S) VReg-3.6(REF)
NetC5-14_1: C5-14.1 VReg-4.5(REF_S) VReg-4.6(REF)
NetC6-1_1: C6-1.1 C6-2.1 VReg-2.1(VREG)
NetC6-6_2: C6-6.2 CE3-6.1 VReg-2.3(BYP)
NetC6-7_1: C6-7.1 C6-8.1 VReg-3.1(VREG)
NetC6-11_2: C6-11.2 CE3-7.1 VReg-3.3(BYP)
NetC6-14_1: C6-14.1 C6-15.1 VReg-4.1(VREG)
NetC6-18_2: C6-18.2 CE3-8.1 VReg-4.3(BYP)
NetC8-15_1: C8-15.1 OpAmp-1.13(Vref2)
NetC8-16_2: C8-16.2 HHall1.1 OpAmp-1.4(Vref1)
NetCE3-2_2: CE3-2.2 R7-2.1
NetCE3-3_2: CE3-3.2 R7-1.1
NetCLC-1_2: CLC-1.2 Mux2.28(DA)
NetCLC-2_2: CLC-2.2 Mux2.2(DB)
NetCLC-3_2: CLC-3.2 Mux1.2(DB)
NetCLC-4_2: CLC-4.2 Mux1.28(DA)
NetCLC-5_1: CLC-5.1 R12-5.1
NetCLC-6_1: CLC-6.1 R12-6.1
NetCon1_1: Con1.1(Centre) RFF-1.1(RFIn)
NetCon2_1: Con2.1(Centre) RFF-2.1(RFIn)
NetCon3_1: Con3.1(Centre) RFF-3.1(RFIn)
NetCon4_1: Con4.1(Centre) RFF-4.1(RFIn)
NetHHall1_2: HHall1.2 OpAmp-1.6(Vout1)
NetJ1-1_2: J1-1.2 Opa1-1.5(VINB+)
NetJ1-2_2: J1-2.2 Opa1-2.3(VINA+)
NetLL-2_2: LL-2.2(C) R10-2.2
NetLL-3_2: LL-3.2(C) R10-3.2
NetLL-4_2: LL-4.2(C) R10-4.2
NetLL-5_2: LL-5.2(C) R8-6.1
NetLL-6_2: LL-6.2(C) R10-6.2
NetOpa1-1_2: Opa1-1.2(VINA-) R9-1.2 R9-2.1
NetOpa2-1_1: Opa2-1.1(Out) Opa2-1.4(In-) R12-1.1
NetOpa2-2_1: Opa2-2.1(Out) Opa2-2.4(In-) R12-2.1
NetOpAmp-1_10: OpAmp-1.10(Vout2) OpAmp-1.11(Vin-)
NetOpAmp-1_12: OpAmp-1.12(Vin+) R00.2
NetR1-3_1: R1-3.1 R1-4.2
NetR3-1_2: R3-1.2 RF_Mag_1.10(TADJ)
NetR3-2_2: R3-2.2 RF_Mag_2.10(TADJ)
NetR3-3_2: R3-3.2 RF_Mag_3.10(TADJ)
NetR3-4_2: R3-4.2 RF_Mag_4.10(TADJ)
NetR4-1_2: R4-1.2 RF_PM_1.12(MSEG) RF_PM_1.13(VMAG)
NetR4-2_2: R4-2.2 RF_PM_1.9(VPHS) RF_PM_1.10(PSET)
NetR4-3_2: R4-3.2 RF_PM_1.11(VREF)
NetR4-4_2: R4-4.2 RF_PM_2.12(MSEG) RF_PM_2.13(VMAG)
NetR4-5_2: R4-5.2 RF_PM_2.11(VREF)
NetR4-6_2: R4-6.2 RF_PM_2.9(VPHS) RF_PM_2.10(PSET)
NetRFF-1_4: RFF-1.4(RFOut) RFS-1.1(In)
NetRFF-2_4: RFF-2.4(RFOut) RFS-2.1(In)
NetRFF-3_4: RFF-3.4(RFOut) RFS-3.1(In)
NetRFS-2_3: RFS-2.3(OutB) RFS-4.1(In)

Not connected (* = marked no-connect by the designer): ADC2 13(DRD~{Y}) 19(AIN11) 25(NC); Buf1 1(NC); H1 4 5 7 8 9 10; Iso-1 2(NC) 4(NC) 8(NC) 10(NC) 13(NC) 15(NC); Mux1 3(NC) 13(NC) 14(NC); Mux2 3(NC) 13(NC) 14(NC); N1 1(NC); Opa1-2 5(VINB+) 6(VINB-) 7(VOUTB); OpAmp-1 3(NC) 5(NC) 7(NC) 14(NC); PWM1 16(LED9); RF_Mag_1 13(TEMP); RF_Mag_2 13(TEMP); RF_Mag_3 13(TEMP); RF_Mag_4 13(TEMP); VReg-1 12(VADJ); VReg-5 6(SS); VReg-6 6(SS); VReg-7 6(SS)

## Buses and harness runs
bus DRTDN[1..6]
bus DRTDP[1..6]
bus SWEN[1..7]
bus VRTDN[1..6]
bus VRTDP[1..6]

## Notes on the sheet
- (near C5-24) Generates isolated hall analog output - surplus for now, dont solder.
- STAR GRound goes here!
- (near R13-1) Connects to either H3 or H4 on Syncboard.
  Note we dont use some of the pins here though could if needed...
- 12V/16.7A isolated power brick input
- (near PWM1) Make sure you get the PWM that is low output by default...
- (near HP-2) Misc Header for grounding
- HB=High = Turn things on
- MAX INPUT POWER=4dbm
- 4x RF inputs, one of which is surplus in case of future expansion need.
  1=Bore Pickup
  2=Forward power
  3=Backward Power
  4=Spare
- Layout Notes- Want 50 Ohm inbound. Traces in this area should be CPWG on 1.6mm FR4. This means solid ground backing, 1.5mm trace width with 0.25mm coplanar pullback of ground and via stitching along trace side.
- POWER::
  60mA per AD8318 and 25mA per AD8302 and maybe another 50 total gives 390mA total, or 330mA if not using Con4: Needs own PSU!
- Note much of RTD circuit is pulled from Senseboard oN LTEM tho we run at double current here as we expect more noise/dont care about self heating as much. We will run RTDs at 0.5mA and want to run from -20 to 180C which means may be 900 to 1700 ohms, or 0.45V to 0.85V drop. If we run 2 gain this means input range is 0.9 to 1.7V. ie. our reference needs to be 1.7V minimum. From datasheet we need to have min absolute input voltage 0.575 and max 4.425 so we are in range. Thus lower voltage on RTD must be 4.425-0.85=3.575 or 2.7/0.5mA=7.1k to ground. To create 2.0V reference would thus require 4 to 6k  which is viable and chose 4.7k.  We put 499 below this to give 0.25V to boost off opamp rails which is well within budget. To deliver this current then at maximum RTDI pin needs to be 0.5mA*(1700+4700+500)=3.45V which should be ok.
- This Switch lets you flip order of power down RTD wires if you think there is offset eg rectified RF or similar issue.
- These stages do band pass filtering around 500MHz (could swap to another part if needed or solder a wire across it) then split them multi-way (each split is 50:50) to allow many detectors.
- Note for everything with RF filters (LFL parts) put those at endge/entry of board an the RC filters near the ADC
- Input HPF at 33Mhz, output CFLP gives low pass of 200hz.
- ADC Setup:
  Use RefP/N0 for all RTD measurements. Use Ain6/7 as ref for hall sensor. Use internal ref for everything else (should be 0 to 2.5V). Fluxgate(P-N) should run from 3.3/2 to -3.3/2 so in-range. The RH/T_RH should run from 1.25 to 3.75
- High Power Load Switches
- LED Graphs
- RTD Interfaces
- (near C1-43) Controls ZYSWA-2-50DR+ which needs 5V TTL signal and a 5/-5 V power supply. BUffer here shifts to 5V logic without slowing it down...
- Can supply 5A per channel at PWM up to 1khz
- Improve instrument Ambience
  Sorry for messy naming conventions
- Note channels 7 and 8 go to the sensor flex.
- (near R9-1) This allows to scale voltages against the Vref (1.8V) coming from the AD8302 - probably use the first one as I think we care more about it but this lets us choose...
- (near Opa1-1) These opamps insulate output and map from 2.2V -> 0.4V magnitude voltages to a range of 0->1.8V.
- Default RF12
- (in symbol CLC_Filter) CLC

## Library data of the parts
ADC2 = ADS124S08: Manufacturer: Texas Instruments; Manufacturer Part Number: ADS124S08IPBSR; Interface: SPI; Digikey P/N: 296-45170-1-ND; Case/Package: TQFP; Height: 1.2mm; Category: Analog to Digital Converters (ADCs)
C1-1-C1-25 C1-30-C1-36 C1-43-C1-45 C2-21 C3-1-C3-26 C4-1-C4-8 C4-10 C9-1 C9-2 C9-4 = Capacitor1
  C1-32-C1-36: Digikey P/N: 311-1140-1-ND
  C2-21 C3-1-C3-26: Digikey P/N: 399-11246-1-ND
  C4-1-C4-8 C4-10: Digikey P/N: 478-KGM21AR71E474JUCT-ND
  C9-1 C9-2 C9-4: Digikey P/N: 490-GRT31C5C1H104FA02LCT-ND
C2-1 C6-1-C6-21 = Cap 0805: Capacitor
  C2-1: Digikey P/N: 587-3485-1-ND
  C6-1-C6-21: Digikey P/N: 490-14439-1-ND
C5-1 C5-2 C5-5-C5-14 C5-16-C5-21 C5-24 C5-25 C7-1 C7-2 C8-1-C8-7 C8-15 C8-16 = Capacitor1205
  C5-1 C5-2 C5-5-C5-14 C5-16-C5-21 C5-24 C5-25: Digikey P/N: 1276-6767-1-ND
  C7-1 C7-2: Digikey P/N: 1276-1066-1-ND
  C8-1-C8-7 C8-15 C8-16: Digikey P/N: 490-1642-1-ND
CE1-1 CE2-1 = CapElectrolytic
  CE1-1: Digikey P/N: 732-9249-1-ND
  CE2-1: Digikey P/N: 565-3414-ND
CE3-1-CE3-8 = CapElectrolytic_LowESR: Digikey P/N: 493-6454-1-ND
CF-5-CF-14 = CapFeedthrough: Digikey P/N: 709-EMCF500W472M1GV001TCT-ND
I1 = Inductor6: Digikey P/N: 732-3881-1-ND
I2 = Inductor7: Digikey P/N: 732-6179-1-ND
PWM1 = PWM28: PWM; Digikey P/N: 568-11925-1-ND
R00 R1-1-R1-5 R1-13 R1-14 R1-16 R2-1-R2-8 R3-1-R3-5 R4-1-R4-6 R5-1 R6-1 R8-6 R9-1 R9-2 R11-1 = Res1: Resistor; FP: 0603 (1608 Metric)
  R00 R1-1-R1-5 R1-13 R1-14 R1-16: Digikey P/N: 311-10.0KHRCT-ND
  R2-1-R2-8 R6-1: Digikey P/N: A127196CT-ND
  R3-1-R3-5: Digikey P/N: A139814CT-ND
  R4-1-R4-6: Digikey P/N: TNP100AACT-ND
  R8-6: Digikey P/N: P2.49KDBCT-ND
  R9-1 R9-2: Digikey P/N: YAG4565CT-ND
  R11-1: Digikey P/N: 408-1642-1-ND
R7-1 R7-2 R10-2-R10-4 R10-6 = Res1: Resistor
  R7-1 R7-2: Digikey P/N: 2019-SG73P2BTTD1R50FCT-ND
  R10-2-R10-4 R10-6: Digikey P/N: 311-330HRCT-ND
R12-1-R12-6 R13-1 R13-2 = Res1
  R12-1-R12-6: Digikey P/N: A140905CT-ND
TVS1 = TVS_Uni_24V: Digikey P/N: SMCJ13ABCT-ND
ADC1 = ADS7828: Digikey P/N: 296-24101-1-ND
Buf1 = Buffer_Logic: Digikey P/N: 74LVC1G34W5-7DICT-ND
CLC-1-CLC-6 = CLC_Filter: Digikey P/N: 709-EMCF500W472M1GV001TCT-ND, 240-2559-1-ND
Con1-Con4 = SMASide: Digikey P/N: ARF1744-ND
Con_S = Connector_LSHM_110: Digikey P/N: SAM15998CT-ND
D2 = Diode_Sschottky: Digikey P/N: RBR3MM30ATFCT-ND
F-1 = FerriteBead3: Digikey P/N: 732-2394-1-ND
H1 = Header_RA_2x10: Digikey P/N: SAM8104-ND, SAM8089-ND
H2 = HeaderPower_Molx: Digikey P/N: WM23323-ND, 1470-4869-ND
HHall1 = Header1x4: Digikey P/N: ED10563-ND
HP-2 HP-4 = Header_1x2B: Digikey P/N: 277-5924-ND
Iso-1 = Isolator_I2C: Digikey P/N: 296-ISO1640QDWRQ1CT-ND
Iso-2 = Isolator_SPI_1: Digikey P/N: 296-ISO6761QDWRQ1CT-ND
J1-1 J1-2 = Jumper3: Digikey P/M: 609-3461-ND, S9000-ND
LL-2-LL-6 = LED_housed: Digikey P/N: 67-1083-ND, 67-1084-ND, 67-1082-ND
Mux1 Mux2 = Switch_Mux8_x2: Digikey P/N: 505-ADG707BRUZ-ND
N1 = NOT: Digikey P/N: 1727-74LVC1G14GV-Q100,1CT-ND
Opa1-1 Opa1-2 = MCP6002: Digikey P/N: MCP6002T-I/MSCT-ND
Opa2-1 Opa2-2 = Amplifier_Precision2: Digikey P/N: 296-OPA388QDBVRQ1CT-ND
OpAmp-1 = Amplifier_Isolator: Digikey P/N: 505-ADUM3195WBRQZ-ND
RF_Mag_1-RF_Mag_4 = AD8318: Digikey P/N: 505-AD8318ACPZ-REEL7CT-ND
RF_PM_1 RF_PM_2 = AD8302: Digikey P/N: 505-AD8302ARUZ-REELCT-ND
RFF-1-RFF-4 = RFFilter1: Digikey P/N: 478-BP2816A0480SNTR\50CT-ND
RFS1 = SMA_Female: Digikey P/N: 2057-RF2-04A-T-00-50-G-ND
RFS-1-RFS-4 = RFSplitter1: Digikey P/N: 408-2051-1-ND
Sw1 = Switch_Analog_2_C: Digikey P/N: 296-53597-1-ND
VReg-1 = Regulator_6V5_Switched: Digikey P/N: 945-1730-5-ND
VReg-2 VReg-3 = Regulator_5V_Lownoise: Digikey P/N: ADM7150ARDZ-5.0-R7CT-ND
VReg-4 = Regulator_3V3_Lownoise: Digikey P/N: 505-ADM7150ARDZ-3.3-R7CT-ND
VReg-5-VReg-7 = Regulator_3V3_LownoiseB
  VReg-5: Digikey P/N: ADP7118ARDZ-3.3-R7CT-ND
  VReg-6 VReg-7: Digikey P/N: ADP7118ARDZ-5.0-R7CT-ND
VReg-8 = VReg_PM5: Digikey P/N: 945-1820-5-ND